# Altium schematic sheet Transceptor CAN.SchDoc
size A4; SheetNumber: 4; SheetTotal: 7
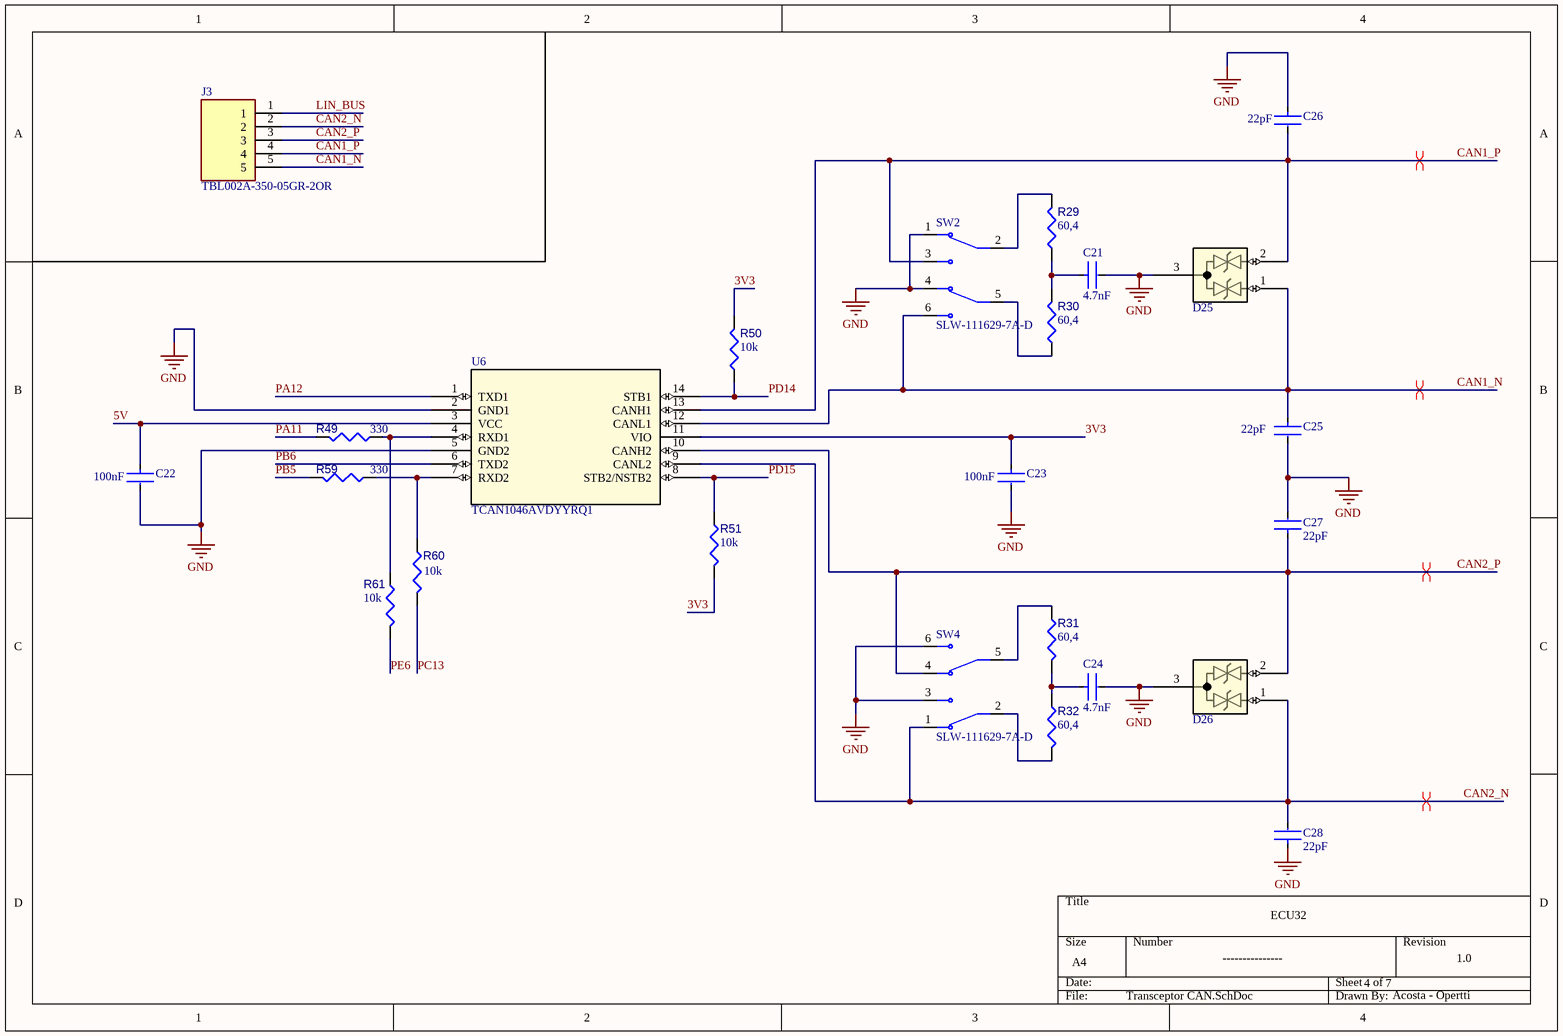
[diagram p0: Transceptor CAN.SchDoc]

## Parts
C21  Capacitance: 4.7nF  [FP-RCE0DB-MFG]  (hidden comment: RCE5C1H100J0A2H03B)
C22  Capacitance: 100nF  [FP-RCE0DB-MFG]  (hidden comment: RCE5C1H100J0A2H03B)
C23  Capacitance: 100nF  [FP-RCE0DB-MFG]  (hidden comment: RCE5C1H100J0A2H03B)
C24  Capacitance: 4.7nF  [FP-RCE0DB-MFG]  (hidden comment: RCE5C1H100J0A2H03B)
C25  Capacitance: 22pF  [FP-RCE0DB-MFG]  (hidden comment: RCE5C1H100J0A2H03B)
C26  Capacitance: 22pF  [FP-RCE0DB-MFG]  (hidden comment: RCE5C1H100J0A2H03B)
C27  Capacitance: 22pF  [FP-RCE0DB-MFG]  (hidden comment: RCE5C1H100J0A2H03B)
C28  Capacitance: 22pF  [FP-RCE0DB-MFG]  (hidden comment: RCE5C1H100J0A2H03B)
D25  ESD2CAN36DBZRQ1  [SOT-23-3_DBZ_TEX]  (value not drawn)
D26  ESD2CAN36DBZRQ1  [SOT-23-3_DBZ_TEX]  (value not drawn)
J3  TBL002A-350-05GR-2OR  [TBL002A-350-05GR-2OR-Footprint-1]
R29  value 60,4  [RESA60-630X240]  (hidden comment: MFR-25FBF52-47R5)
R30  value 60,4  [RESA60-630X240]  (hidden comment: MFR-25FBF52-47R5)
R31  value 60,4  [RESA60-630X240]  (hidden comment: MFR-25FBF52-47R5)
R32  value 60,4  [RESA60-630X240]  (hidden comment: MFR-25FBF52-47R5)
R49  value 330  [RESA60-630X240]  (hidden comment: MFR-25FBF52-47R5)
R50  value 10k  [RESA60-630X240]  (hidden comment: MFR-25FBF52-47R5)
R51  value 10k  [RESA60-630X240]  (hidden comment: MFR-25FBF52-47R5)
R59  value 330  [RESA60-630X240]  (hidden comment: MFR-25FBF52-47R5)
R60  value 10k  [RESA60-630X240]  (hidden comment: MFR-25FBF52-47R5)
R61  value 10k  [RESA60-630X240]  (hidden comment: MFR-25FBF52-47R5)
SW2  SLW-111629-7A-D  [SLW-111629-7A-D-Footprint-1]
SW4  SLW-111629-7A-D  [SLW-111629-7A-D-Footprint-1]
U6  TCAN1046AVDYYRQ1  [TCAN1046AVDYYRQ1-Footprint-1]

## Nets
GND: C21.2 C22.2 C23.2 C24.2 C25.2 C26.1 C27.2 C28.1 D25.3(GND) D26.3(GND) SW2.1 SW2.4 SW4.3 SW4.6 U6.2(GND1) U6.5(GND2)
3V3: C23.1 R50.1 R51.2 U6.11(VIO)
5V: C22.1 U6.3(VCC)
CAN1_N: C25.1 D25.1(IO) J3.5 SW2.6 U6.12(CANL1)
CAN1_P: C26.2 D25.2(IO) J3.4 SW2.3 U6.13(CANH1)
CAN2_N: C28.2 D26.1(IO) J3.2 SW4.1 U6.9(CANL2)
CAN2_P: C27.1 D26.2(IO) J3.3 SW4.4 U6.10(CANH2)
LIN_BUS: J3.1
PA11: R49.1
PA12: U6.1(TXD1)
PB5: R59.1
PB6: U6.6(TXD2)
PC13: R60.1
PD14: R50.2 U6.14(STB1)
PD15: R51.1 U6.8(STB2/NSTB2)
PE6: R61.1
NetC21_1: C21.1 R29.2 R30.1
NetC24_1: C24.1 R31.2 R32.1
NetR29_1: R29.1 SW2.2
NetR30_2: R30.2 SW2.5
NetR31_1: R31.1 SW4.5
NetR32_2: R32.2 SW4.2
NetR49_2: R49.2 R61.2 U6.4(RXD1)
NetR59_2: R59.2 R60.2 U6.7(RXD2)

## Layout directives
differential pair: CAN1_N, CAN1_P, CAN2_N, CAN2_P

## Notes on the sheet
- ECU32
- ---------------
- 4
- 7
- 1.0
- Acosta - Opertti

## Library data of the parts
C21-C28 = CMP-06035-046743-1: Cap Ceramic 10pF 50V C0G ±5% Radial 2.5mm +125°C Bulk; Lead Diameter: 0.5mm; Lead/Base Style: Straight; Width: 2.5mm; Voltage Rating: 50V; Max Operating Temperature: 125°C; Length: 0.142inch; Lead Pitch: 0.098inch; Min Operating Temperature: -55°C; Termination: Radial; Tolerance: 5%; Dielectric: C0G; Packaging: Bulk; Package Quantity: 500; Voltage Rating (DC): 50V; Case/Package: Radial; Ratings: AEC-Q200; Lead Free: Lead Free; Height: 3.5mm; Resistor Type: Ceramic; Height - Seated (Max): 0.138inch; Mount: Through Hole
D25 D26 = CMP-004-00031-1: Automotive, two-channel bidirectional 36V ESD protection diode 3-SOT-23 -55 to 150; Manufacturer_Name: Texas Instruments; Design Item ID: ESD2CAN36DBZRQ1; Copyright: Copyright (C) 2025 Ultra Librarian. All rights reserved.; Source: ESD2CAN36DBZRQ1.SchLib; Manufacturer_Part_Number: ESD2CAN36DBZRQ1; Type: Type; RefDes: RefDes
J3 = CMP-002-00072-1: 1~24 Poles, Screwless, 45°, 3.50 Pitch, 24~20 (AWG), Terminal Block Connector; Voltage Rating: 300V; Max Operating Temperature: 105°C; Min Operating Temperature: -40°C; Pins: 5
R29-R32 R49-R51 R59-R61 = CMP-009-00058-4: Axial Resistor, 47.5 Ohm, +/- 1%, 0.25 W, -55 to 155 degC, 2-Pin THD, RoHS, Bulk; Manufacturer: Yageo; Voltage Rating: 250V; Power: 250mW; Packaging: Bulk; Package Description: 2-Pin Axial Lead, Dia 2.4 mm, Body Length 6.3 mm; Package Reference: MFR-25; Case/Package: Axial; Tolerance: 1%; RoHS Compliant: True; Package Quantity: 200; Max Operating Temperature: 155°C; Manufacturer URL: http://www.yageo.com/; Datasheet URL: http://www.yageo.com/documents/recent/Yageo%20LR_MFR_2013.pdf; Min Operating Temperature: -55°C; Datasheet Version: Apr-13; Mounting Technology: TH
SW2 SW4 = CMP-011-00013-1: Switch Slide ON ON DPDT Raised Slide 0.5A 50VDC 10000Cycles PC Pins Thru-Hole Box
U6 = CMP-015-00009-1: Enhanced Automotive Dual Can Tra / 2/2 Transceiver Canbus 14-SOT-23-THIN; Pins: 14